# Altium project Solenoid-Switching-Board-v1.0.PrjPcb
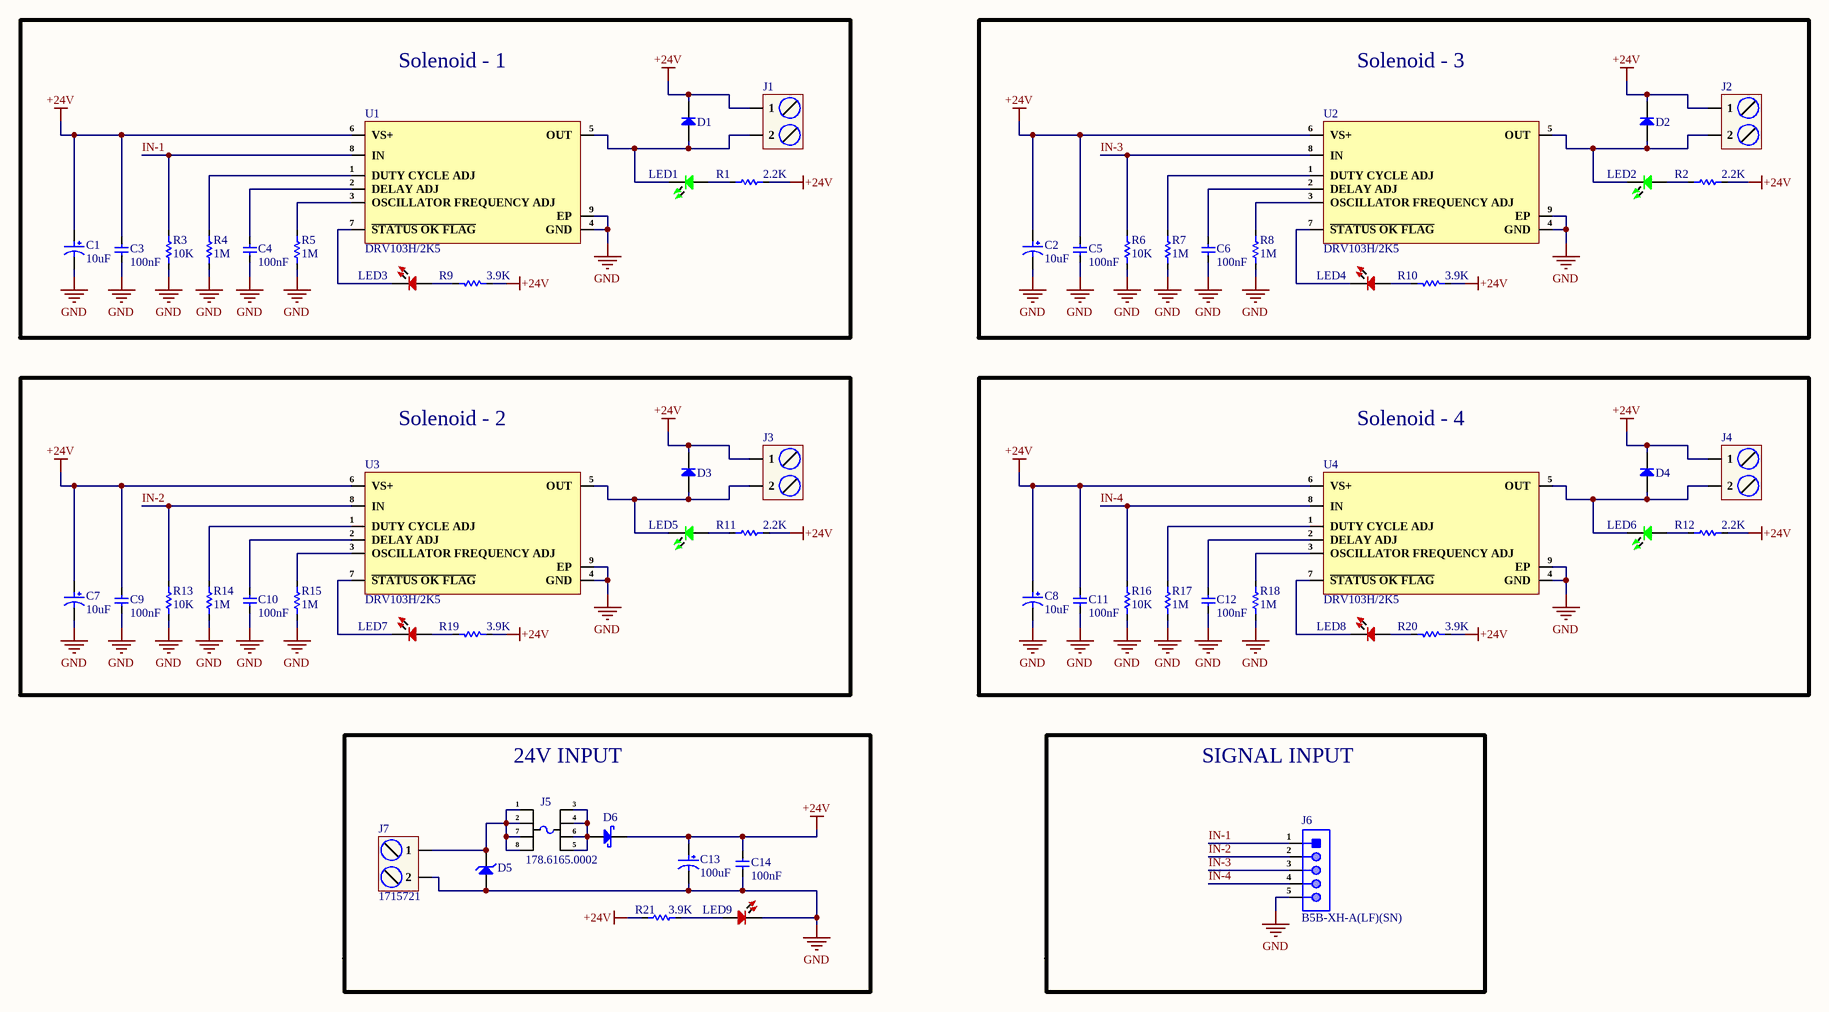
[diagram p0: Solenoid-Board.SchDoc]
1 sheet, 61 parts. Net scope: global (net labels, ports and power ports of the same name join across sheets).
Board file: PCB_Solenoid_Board-v1.0.PcbDoc

## Sheet Solenoid-Board.SchDoc
size 420 x 297 mm; SheetNumber: 1; SheetTotal: 1

### Parts
C1  10uF  [50SVPF10M]
C2  10uF  [50SVPF10M]
C3  100nF  [Cap-0603]
C4  100nF  [Cap-0603]
C5  100nF  [Cap-0603]
C6  100nF  [Cap-0603]
C7  10uF  [50SVPF10M]
C8  10uF  [50SVPF10M]
C9  100nF  [Cap-0603]
C10  100nF  [Cap-0603]
C11  100nF  [Cap-0603]
C12  100nF  [Cap-0603]
C13  100uF  [RVT1H101M0607]
C14  100nF  [Cap-0603]
D1  MURS360T3G  [SMC]  (value not drawn)
D2  MURS360T3G  [SMC]  (value not drawn)
D3  MURS360T3G  [SMC]  (value not drawn)
D4  MURS360T3G  [SMC]  (value not drawn)
D5  SMBJ28A-13-F  [SMB_]  (value not drawn)
D6  SS56  [SMA]  (value not drawn)
J1  DB125-3.81-2P-BK-S  [DB125-3.81-2P-BK-S]  (value not drawn)
J2  DB125-3.81-2P-BK-S  [DB125-3.81-2P-BK-S]  (value not drawn)
J3  DB125-3.81-2P-BK-S  [DB125-3.81-2P-BK-S]  (value not drawn)
J4  DB125-3.81-2P-BK-S  [DB125-3.81-2P-BK-S]  (value not drawn)
J5  178.6165.0002  [178.6165.0002]
J6  B5B-XH-A(LF)(SN)  [B5B-XH-A(LF)(SN)_]
J7  1715721  [1715721]
LED1  Emerald  [LED-0603]  (value not drawn)
LED2  Emerald  [LED-0603]  (value not drawn)
LED3  RED  [LED-0603]  (value not drawn)
LED4  RED  [LED-0603]  (value not drawn)
LED5  Emerald  [LED-0603]  (value not drawn)
LED6  Emerald  [LED-0603]  (value not drawn)
LED7  RED  [LED-0603]  (value not drawn)
LED8  RED  [LED-0603]  (value not drawn)
LED9  RED  [LED-0603]  (value not drawn)
R1  2.2K  [Res-0402]
R2  2.2K  [Res-0402]
R3  10K  [Res-0402]
R4  1M  [Res-0402]
R5  1M  [Res-0402]
R6  10K  [Res-0402]
R7  1M  [Res-0402]
R8  1M  [Res-0402]
R9  3.9K  [Res-0402]
R10  3.9K  [Res-0402]
R11  2.2K  [Res-0402]
R12  2.2K  [Res-0402]
R13  10K  [Res-0402]
R14  1M  [Res-0402]
R15  1M  [Res-0402]
R16  10K  [Res-0402]
R17  1M  [Res-0402]
R18  1M  [Res-0402]
R19  3.9K  [Res-0402]
R20  3.9K  [Res-0402]
R21  3.9K  [Res-0402]
U1  DRV103H/2K5  [8-SO PowerPad]
U2  DRV103H/2K5  [8-SO PowerPad]
U3  DRV103H/2K5  [8-SO PowerPad]
U4  DRV103H/2K5  [8-SO PowerPad]

### Blocks framed on the sheet
Solenoid - 1: C1 C3 C4 D1 J1 LED1 LED3 R1 R3-R5 R9 U1
Solenoid - 3: C2 C5 C6 D2 J2 LED2 LED4 R2 R6-R8 R10 U2
Solenoid - 2: C7 C9 C10 D3 J3 LED5 LED7 R11 R13-R15 R19 U3
Solenoid - 4: C8 C11 C12 D4 J4 LED6 LED8 R12 R16-R18 R20 U4
24V INPUT: C13 C14 D5 D6 J5 J7 LED9 R21
SIGNAL INPUT: J6

### Nets
+24V: C1.1 C2.1 C3.2 C5.2 C7.1 C8.1 C9.2 C11.2 C13.1 C14.2 D1.1(K) D2.1(K) D3.1(K) D4.1(K) D6.1(K) J1.1 J2.1 J3.1 J4.1 R1.2 R2.2 R9.1 R10.1 R11.2 R12.2 R19.1 R20.1 R21.1 U1.6(VS+) U2.6(VS+) U3.6(VS+) U4.6(VS+)
GND: C1.2 C2.2 C3.1 C4.1 C5.1 C6.1 C7.2 C8.2 C9.1 C10.1 C11.1 C12.1 C13.2 C14.1 D5.1(A) J6.5 J7.2 LED9.2 R3.1 R4.1 R5.1 R6.1 R7.1 R8.1 R13.1 R14.1 R15.1 R16.1 R17.1 R18.1 U1.4(GND) U1.9(EP) U2.4(GND) U2.9(EP) U3.4(GND) U3.9(EP) U4.4(GND) U4.9(EP)
IN-1: J6.1 R3.2 U1.8(IN)
IN-2: J6.2 R13.2 U3.8(IN)
IN-3: J6.3 R6.2 U2.8(IN)
IN-4: J6.4 R16.2 U4.8(IN)
NetC4_2: C4.2 U1.2(DELAY_ADJ)
NetC6_2: C6.2 U2.2(DELAY_ADJ)
NetC10_2: C10.2 U3.2(DELAY_ADJ)
NetC12_2: C12.2 U4.2(DELAY_ADJ)
NetD1_2: D1.2(A) J1.2 LED1.2 U1.5(OUT)
NetD2_2: D2.2(A) J2.2 LED2.2 U2.5(OUT)
NetD3_2: D3.2(A) J3.2 LED5.2 U3.5(OUT)
NetD4_2: D4.2(A) J4.2 LED6.2 U4.5(OUT)
NetD5_2: D5.2(K) J5.1 J5.2 J5.7 J5.8 J7.1
NetD6_2: D6.2(A) J5.3 J5.4 J5.5 J5.6
NetLED1_1: LED1.1 R1.1
NetLED2_1: LED2.1 R2.1
NetLED3_1: LED3.1 R9.2
NetLED3_2: LED3.2 U1.7(~{STATUS_OK_FLAG})
NetLED4_1: LED4.1 R10.2
NetLED4_2: LED4.2 U2.7(~{STATUS_OK_FLAG})
NetLED5_1: LED5.1 R11.1
NetLED6_1: LED6.1 R12.1
NetLED7_1: LED7.1 R19.2
NetLED7_2: LED7.2 U3.7(~{STATUS_OK_FLAG})
NetLED8_1: LED8.1 R20.2
NetLED8_2: LED8.2 U4.7(~{STATUS_OK_FLAG})
NetLED9_1: LED9.1 R21.2
NetR4_2: R4.2 U1.1(DUTY_CYCLE_ADJ)
NetR5_2: R5.2 U1.3(OSCILLATOR_FREQUENCY_ADJ)
NetR7_2: R7.2 U2.1(DUTY_CYCLE_ADJ)
NetR8_2: R8.2 U2.3(OSCILLATOR_FREQUENCY_ADJ)
NetR14_2: R14.2 U3.1(DUTY_CYCLE_ADJ)
NetR15_2: R15.2 U3.3(OSCILLATOR_FREQUENCY_ADJ)
NetR17_2: R17.2 U4.1(DUTY_CYCLE_ADJ)
NetR18_2: R18.2 U4.3(OSCILLATOR_FREQUENCY_ADJ)

### Notes on the sheet
- File:
- Title:
- Date:
- Page
- Num:
- Total:
- Drawn By: Huzaifa Ali

### Library data of the parts
C1 C2 C7 C8 = 50SVPF10M: CAP ALUM POLY 10UF 20% 50V SMD; Manufacturer: Panasonic; Material: 4242ConductorMaterial; Item Type: Capacitor; Supplier: Mouser; Supplier Part Number: 667-50SVPF10M; Manufacturer Part Number: 50SVPF10M; RoHS: Yes; Category: Polymer Capacitors; Stock: 29802; Pricing: 1=1.12, 10=0.801, 50=0.801, 100=0.665, 1000=0.555, 10000=0.504 (USD); ComponentLink1URL: https://datasheet.ciiva.com/48542/svpf-eng-ds-48542427.pdf?src-supplier=Distrelec; ComponentLink1Description: https://datasheet.ciiva.com/48542/svpf-eng-ds-48542427.pdf?src-supplier=Distrelec; ComponentLink2URL: https://datasheet.ciiva.com/24216/svpf-os-262415-24216043.pdf?src-supplier=Mouser; ComponentLink2Description: https://datasheet.ciiva.com/24216/svpf-os-262415-24216043.pdf?src-supplier=Mouser; ComponentLink3URL: https://datasheet.ciiva.com/25761/1734360-25761263.pdf?src-supplier=Farnell; ComponentLink3Description: https://datasheet.ciiva.com/25761/1734360-25761263.pdf?src-supplier=Farnell; LCSC Part Number: C2162323
C3-C6 C9-C12 C14 = CC0603KRX5R9BB104: CAP CER 0.1UF 50V X5R 0603; Manufacturer: Yageo; Tolerance: 10%; Item Type: Capacitor; Supplier 1: Digi-Key; Manufacturer Part Number: CC0603KRX5R9BB104; RoHS: Yes; Category: Ceramic Capacitors; Stock 1: 152253; Pricing 1: 1=0.10000, 10=0.05200, 50=0.02820, 100=0.02310, 500=0.01648, 1000=0.01294 (USD); Mount: Surface Mount; Case/Package: 0603; Case Code (Imperial): 0603; Case Code (Metric): 1608; Weight: 7.1E-05oz; Min Operating Temperature: -55°C; Max Operating Temperature: 85°C; Capacitance: 100nF; Packaging: Tape and Reel; Voltage Rating: 50V; Dielectric: X5R; Termination: SMD/SMT; Voltage Rating (DC): 50V; Package Quantity: 4000; Length: 0.063inch; Width: 0.031inch; Thickness: 0.035inch; Lead Free: Lead Free; Halogen Free: Halogen Free; ComponentLink1URL: http://www.mouser.com/ds/2/447/Yageo_UPY-GP_NP0_16V-to-50V_9-358835.pdf?src-supplier=Mouser; ComponentLink1Description: http://www.mouser.com/ds/2/447/Yageo_UPY-GP_NP0_16V-to-50V_9-358835.pdf?src-supplier=Mouser; ComponentLink2URL: https://www.yageo.com/upload/media/product/productsearch/datasheet/mlcc/UPY-GPHC_X5R_4V-to-50V_26.pdf?src-supplier=Digi-Key; ComponentLink2Description: https://www.yageo.com/upload/media/product/productsearch/datasheet/mlcc/UPY-GPHC_X5R_4V-to-50V_26.pdf?src-supplier=Digi-Key; ComponentLink3URL: http://www.yageo.com/exep/pages/download/literatures/ProductSelectionGuide%202014_Final_2.pdf?src-supplier=Digi-Key; ComponentLink3Description: http://www.yageo.com/exep/pages/download/literatures/ProductSelectionGuide%202014_Final_2.pdf?src-supplier=Digi-Key; Supplier Part Number 1: 311-4046-1-ND; LCSC Part Number: C110022
C13 = RVT1H101M0607: 100uF 50V ±20% SMD,D6.3xL7.7mm Aluminum Electrolytic Capacitors - SMD ROHS; Manufacturer: ROQANG; Manufacturer Part Number: RVT1H101M0607; Package: SMD,D6.3xL7.7mm; LCSC Part Number: C3151829; Item Type: Capacitor; ComponentLink1Description: LCSC; ComponentLink1URL: https://www.lcsc.com/product-detail/Aluminum-Electrolytic-Capacitors-SMD_ROQANG-RVT1H101M0607_C3151829.html
D1-D4 = MURS360T3G: SMC(DO-214AB) Diodes - Fast Recovery Rectifiers ROHS; Manufacturer: FUXINSEMI; Manufacturer Part Number: MURS360T3G; Package: SMC(DO-214AB); LCSC Part Number: C7436549; Item Type: Diodes; ComponentLink1Description: LCSC; ComponentLink1URL: https://www.lcsc.com/product-detail/Diodes-Fast-Recovery-Rectifiers_FUXINSEMI-MURS360T3G_C7436549.html
D5 = SMBJ28A-13-F: TVS DIODE 28VWM 45.4VC SMB; Manufacturer: Diodes; Test Current: 1mA; Number of Elements: 1; Power Dissipation: 600W; Forward Voltage: 5V; Direction: Unidirectional; Reverse Breakdown Voltage: 31.1V; Max Surge Current: 13.2A; Reverse Standoff Voltage: 28V; Clamping Voltage: 45.4V; Power Line Protection: No; Breakdown Voltage: 35.8V; Max Reverse Leakage Current: 5uA; Value: 330pF; Diode Type: ZENER; Supplier: Future Electronics; Supplier Part Number: 8797342; Manufacturer Part Number: SMBJ28A-13-F; RoHS: Yes; Category: TVS Diodes; Stock: 39000; Pricing: 3000=0.0734, 9000=0.0706, 15000=0.0693, 30000=0.0676, 60000=0.065 (USD); Mounting Technology: Surface Mount; Case/Package: SMB; Pins: 2; Min Operating Temperature: -55°C; Max Operating Temperature: 150°C; Packaging: Tape and Reel; Package Quantity: 3000; Max Power Dissipation: 600W; Series: SMBJ; Number of Unidirectional Channels: 1; Min Breakdown Voltage: 31.1V; Peak Pulse Power: 600W; Polarity: Unidirectional; Termination: SMD/SMT; Peak Pulse Current: 13.2A; Max Breakdown Voltage: 35.8V; Leakage Current: 5uA; Working Voltage: 28V; Voltage Rating (DC): 28V; Max Output current: 13.2A; Clamping Voltage-Max: 45.4V; Length: 4.57mm; Width: 3.9mm; Height: 2.62mm; Radiation Hardening: No; RoHS Compliant: Yes; Lead Free: Lead Free; ComponentLink1URL: https://datasheet.ciiva.com/16387/ds19002-16387564.pdf?src-supplier=Future+Electronics; ComponentLink1Description: https://datasheet.ciiva.com/16387/ds19002-16387564.pdf?src-supplier=Future+Electronics; ComponentLink2URL: https://datasheet.ciiva.com/26912/getdatasheetpartid-234000-26912533.pdf?src-supplier=Verical; ComponentLink2Description: https://datasheet.ciiva.com/26912/getdatasheetpartid-234000-26912533.pdf?src-supplier=Verical; Item Type: Diode
D6 = SS56: DIODE SCHOTTKY 60V 5A SMA; Manufacturer: MDD; LCSC Par Number: C65009; Manufacturer Part Number: SS56; Iterm Type: Diode; ComponentLink1Description: LCSC; ComponentLink1URL: https://www.lcsc.com/product-detail/Schottky-Barrier-Diodes-SBD_MDD-Microdiode-Electronics-SS56_C65009.html
J1-J4 = DB125-3.81-2P-BK-S: 1x2P 10A -40℃~+105℃ 300V Black 16~26 Straight 3.81mm 0.5~1 1 2 Plugin,P=3.81mm Screw terminal ROHS; Manufacturer: DORABO; Item Type: Terminal Block; Manufacturer Part Number: DB125-3.81-2P-BK-S; Package: Plugin,P=3.81mm; LCSC Part Number: C430618; ComponentLink1Description: LCSC; ComponentLink1URL: https://www.lcsc.com/product-detail/Screw-terminal_DORABO-DB125-3-81-2P-BK-S_C430618.html
J5 = 178.6165.0002: FUSE HOLDER BLADE 80V PCB; Manufacturer: Littelfuse Wickmann; Body Material: 4896ConductorMaterial; Current Rating: 30A; Supplier: Future Electronics; Supplier Part Number: 9883406; Manufacturer Part Number: 178.6165.0002; RoHS: Yes; Category: Fuse Holders; Stock: 3811; Pricing: 1=2.02, 40=1.96, 125=1.91, 400=1.86, 1250=1.77 (USD); Material: 4896ConductorMaterial; Width: 17.5mm; Thickness: 6mm; Lead Free: 5697LeadFree; ComponentLink1URL: https://datasheet.ciiva.com/295/littelfuse-ato-pcb-fuse-holders-178-6765-295568.pdf?src-supplier=Digikey; ComponentLink1Description: https://datasheet.ciiva.com/295/littelfuse-ato-pcb-fuse-holders-178-6765-295568.pdf?src-supplier=Digikey; ComponentLink2URL: https://datasheet.ciiva.com/4480/flrholder-58019-4480354.pdf?src-supplier=Mouser; ComponentLink2Description: https://datasheet.ciiva.com/4480/flrholder-58019-4480354.pdf?src-supplier=Mouser; ComponentLink3URL: https://datasheet.ciiva.com/16372/flrholder-16372408.pdf?src-supplier=Future+Electronics; ComponentLink3Description: https://datasheet.ciiva.com/16372/flrholder-16372408.pdf?src-supplier=Future+Electronics; ComponentLink4URL: https://datasheet.ciiva.com/15187/getdatasheetpartid-31610-15187861.pdf?src-supplier=Verical; ComponentLink4Description: https://datasheet.ciiva.com/15187/getdatasheetpartid-31610-15187861.pdf?src-supplier=Verical; LCSC Part Number: C207061; Item Type: Fuse Holder
J6 = B5B-XH-A(LF)(SN): Conn Shrouded Header HDR 5 POS 2.5mm Solder ST Thru-Hole Box; Manufacturer: JST; Current Rating: 3A; Contact Resistance: 20mR; Voltage Rating (AC): 250V; Number of Positions: 5; Insulation Resistance: 1GR; Gender: Male; Wire/Cable Gauge: 22AWG; Contact Post Length: 0.134inch; Mated Stacking Heights: 9.8mm; Item Type: JST Connector; Supplier 1: Digi-Key; Manufacturer Part Number: B5B-XH-A(LF)(SN); RoHS: Yes; Category: Headers and Wire Housings; Stock 1: 1949; Pricing 1: 1=0.25000, 10=0.23700, 100=0.16440, 500=0.13914, 1000=0.11383, 5000=0.10119, 10000=0.09170 (USD); Mount: Through Hole; Contact Material: Brass; Color: Natural; Contact Plating: Tin,Lead,Copper; Housing Color: White; Housing Material: Polyamide; Contact Shape: Square; Contact Finish - Mating: TIN; Insulation Material: Nylon; Insulation Color: Natural; Min Operating Temperature: -25°C; Max Operating Temperature: 85°C; Number of Rows: 1; Packaging: Bulk; Voltage Rating: 250V; Max Current Rating: 3A; Termination: Press-Fit; Fastening Type: Detent; Number of Contacts: 5; Max Voltage Rating (AC): 250V; Orientation: Straight; Connector Type: Header; Series: XH; Contact Type: Male Pin; Length: 14.9mm; Pitch: 2.5mm; Lead Pitch: 2.5mm; Depth: 5.75mm; Insulation Height: 0.276inch; REACH SVHC: No SVHC; Lead Free: Lead Free; Flammability Rating: UL94 V-0; ComponentLink1URL: https://datasheet.ciiva.com/26894/getdatasheetpartid-455618-26894798.pdf?src-supplier=Verical; ComponentLink1Description: https://datasheet.ciiva.com/26894/getdatasheetpartid-455618-26894798.pdf?src-supplier=Verical; ComponentLink2URL: https://datasheet.ciiva.com/11746/0900766b8082f55f-11746654.pdf?src-supplier=RSComponents; ComponentLink2Description: https://datasheet.ciiva.com/11746/0900766b8082f55f-11746654.pdf?src-supplier=RSComponents; ComponentLink3URL: https://datasheet.ciiva.com/26894/getdatasheetpartid-640991-26894479.pdf?src-supplier=Verical; ComponentLink3Description: https://datasheet.ciiva.com/26894/getdatasheetpartid-640991-26894479.pdf?src-supplier=Verical; ComponentLink4URL: https://datasheet.ciiva.com/8052/1684882-8052063.pdf?src-supplier=Element14; ComponentLink4Description: https://datasheet.ciiva.com/8052/1684882-8052063.pdf?src-supplier=Element14; ComponentLink5URL: https://datasheet.ciiva.com/20207/523653-20207174.pdf?src-supplier=Rapid+Electronics; ComponentLink5Description: https://datasheet.ciiva.com/20207/523653-20207174.pdf?src-supplier=Rapid+Electronics; ComponentLink6URL: https://datasheet.ciiva.com/724/exh-724390.pdf?src-supplier=Digi-Key; ComponentLink6Description: https://datasheet.ciiva.com/724/exh-724390.pdf?src-supplier=Digi-Key; Supplier Part Number 1: 455-2270-ND; LCSC Part Number: C157991
J7 = 1715721: TERM BLK 2P SIDE ENT 5.08MM PCB; Manufacturer: Phoenix Contact; Item Type: Terminal Blocks; Supplier: Digikey; Supplier Part Number: 277-1263-ND; Manufacturer Part Number: 1715721; RoHS: Yes; Stock: 13160; Pricing: 1=0.94 (USD); ComponentLink1URL: https://datasheet.ciiva.com/1120/1697161-1120393.pdf?src-supplier=Farnell; ComponentLink1Description: https://datasheet.ciiva.com/1120/1697161-1120393.pdf?src-supplier=Farnell; ComponentLink2URL: https://datasheet.ciiva.com/832/1715721-832095.pdf?src-supplier=Digikey; ComponentLink2Description: https://datasheet.ciiva.com/832/1715721-832095.pdf?src-supplier=Digikey; ComponentLink3URL: https://datasheet.ciiva.com/15169/getdatasheetpartid-212174-15169929.pdf?src-supplier=Verical; ComponentLink3Description: https://datasheet.ciiva.com/15169/getdatasheetpartid-212174-15169929.pdf?src-supplier=Verical; ComponentLink4URL: https://datasheet.ciiva.com/16046/1715721-16046034.pdf?src-supplier=Onlinecomponents.com; ComponentLink4Description: https://datasheet.ciiva.com/16046/1715721-16046034.pdf?src-supplier=Onlinecomponents.com
LED1 LED2 LED5 LED6 = NCD0603G2: Emerald 0603 Light Emitting Diodes (LED) ROHS; Manufacturer: Foshan NationStar Optoelectronics; Manufacturer Part Number: NCD0603G2; Package: 0603; LCSC Part Number: C87326; Item Type: LED; ComponentLink1Description: LCSC; ComponentLink1URL: https://www.lcsc.com/product-detail/Light-Emitting-Diodes-LED_Foshan-NationStar-Optoelectronics-NCD0603G2_C87326.html
LED3 LED4 LED7-LED9 = NCD0603R3: RED LED 0603 Light Emitting Diodes; Manufacturer: Foshan NationStar Optoelectronics; Manufacturer Part Number: NCD0603R3; Package: 0603; Item Type: LED; LCSC Part Number: C3151730; ComponentLink1Description: LCSC; ComponentLink1URL: https://www.lcsc.com/product-detail/Light-Emitting-Diodes-LED_Foshan-NationStar-Optoelectronics-NCD0603R3_C3151730.html
R1 R2 R11 R12 = RC0402FR-072K2L: RES SMD 2.2K OHM 1% 1/16W 0402; Manufacturer: Yageo; Resistance: 2.2kR; Power Rating: 63mW; Voltage Rating: 50V; Temperature Coefficient: 100ppm/°C; Supplier 1: Digi-Key; Manufacturer Part Number: RC0402FR-072K2L; Stock 1: 966157; Pricing 1: 1=0.1, 10=0.016, 100=0.0066, 1000=0.00299, 2500=0.00259, 5000=0.00214 (USD); Case/Package: 0402; Case Code (Imperial): 0402; Case Code (Metric): 1005; Weight: 2.3E-05oz; Size Code: 0402; Min Operating Temperature: -55°C; Max Operating Temperature: 155°C; Resistor Type: Thick Film; Packaging: Tape and Reel; Tolerance: 1%; Termination: SMD/SMT; Features: Moisture Resistant; Series: RC; Max Power Dissipation: 63mW; Number of Terminations: 2; Resistance Tolerance: 1%; Construction: Rectangular; Technology: THICK FILM; Length: 1mm; Width: 0.5mm; Height: 0.35mm; Depth: 0.5mm; RoHS Compliant: Yes; REACH SVHC: Unknown; Military Standard: Not; Lead Free: Lead Free; ComponentLink1URL: http://www.farnell.com/datasheets/2167052.pdf?src-supplier=Element14; ComponentLink1Description: http://www.farnell.com/datasheets/2167052.pdf?src-supplier=Element14; ComponentLink2URL: http://www.yageo.com/documents/recent/PYu-RC_Group_51_RoHS_L_9.pdf?src-supplier=Mouser; ComponentLink2Description: http://www.yageo.com/documents/recent/PYu-RC_Group_51_RoHS_L_9.pdf?src-supplier=Mouser; ComponentLink3URL: http://documents.rs-components.com/techlib://itc_doclist_GB.htm?stockno=6186532&src-supplier=RSComponents; ComponentLink3Description: http://documents.rs-components.com/techlib://itc_doclist_GB.htm?stockno=6186532&src-supplier=RSComponents; ComponentLink4URL: http://www.yageo.com/documents/recent/PYu-RC0402_51_RoHS_L_6_r.pdf?src-supplier=Future+Electronics; ComponentLink4Description: http://www.yageo.com/documents/recent/PYu-RC0402_51_RoHS_L_6_r.pdf?src-supplier=Future+Electronics; Supplier Part Number 1: 311-2.20KLRCT-ND; LCSC Part Number: C114762
R3 R6 R13 R16 = RC0402FR-0710KL: RES 10K OHM 1% 1/16W 0402; Manufacturer: Yageo; Resistance: 10kR; Voltage Rating (DC): 50V; Temperature Coefficient: 100ppm/°C; Power Rating: 62.5mW; Max Power Dissipation: 63mW; Item Type: Resistor; Supplier 1: Mouser; Manufacturer Part Number: RC0402FR-0710KL; RoHS: Yes; Category: Chip SMD Resistors; Stock 1: 18648329; Pricing 1: 1=0.10000, 10=0.01400, 50=0.01400, 100=0.00500, 1000=0.00300, 10000=0.00200 (USD); Case/Package: 0402; Number of Pins: 2; Case Code (Imperial): 0402; Case Code (Metric): 1005; Min Operating Temperature: -55°C; Max Operating Temperature: 155°C; Resistor Type: Thick Film; Tolerance: 1%; Packaging: Tape and Reel; Voltage Rating: 50V; Termination: SMD/SMT; Working Voltage: 50V; Number of Terminations: 2; Features: Moisture Resistant; Series: RC; Resistance Tolerance: 1%; Construction: Rectangular; Length: 1mm; Width: 0.5mm; Height: 0.32mm; Depth: 0.5mm; Lead Pitch: 0.2mm; REACH SVHC: No SVHC; Lead Free: Lead Free; RoHS Compliant: Yes; Military Standard: Not; ComponentLink1URL: https://datasheet.ciiva.com/7660/38568-7660787.pdf?src-supplier=Element14; ComponentLink1Description: https://datasheet.ciiva.com/7660/38568-7660787.pdf?src-supplier=Element14; ComponentLink2URL: https://datasheet.ciiva.com/7849/1686128-7849814.pdf?src-supplier=Element14; ComponentLink2Description: https://datasheet.ciiva.com/7849/1686128-7849814.pdf?src-supplier=Element14; ComponentLink3URL: https://datasheet.ciiva.com/7983/1018594-7983486.pdf?src-supplier=Element14; ComponentLink3Description: https://datasheet.ciiva.com/7983/1018594-7983486.pdf?src-supplier=Element14; ComponentLink4URL: https://datasheet.ciiva.com/22747/1018594-22747512.pdf?src-supplier=Element14; ComponentLink4Description: https://datasheet.ciiva.com/22747/1018594-22747512.pdf?src-supplier=Element14; ComponentLink5URL: https://datasheet.ciiva.com/12667/pyu-rc0402-51-rohs-l-6-r-12667067.pdf?src-supplier=Mouser; ComponentLink5Description: https://datasheet.ciiva.com/12667/pyu-rc0402-51-rohs-l-6-r-12667067.pdf?src-supplier=Mouser; ComponentLink6URL: https://datasheet.ciiva.com/7849/1784430-7849813.pdf?src-supplier=Element14; ComponentLink6Description: https://datasheet.ciiva.com/7849/1784430-7849813.pdf?src-supplier=Element14; ComponentLink7URL: https://datasheet.ciiva.com/7849/1784430-7849815.pdf?src-supplier=Element14; ComponentLink7Description: https://datasheet.ciiva.com/7849/1784430-7849815.pdf?src-supplier=Element14; Supplier Part Number 1: 603-RC0402FR-0710KL; LCSC Part Number: C60490
R4 R5 R7 R8 R14 R15 R17 R18 = RC0402FR-071ML: RES 1M OHM 1% 1/16W 0402; Manufacturer: Yageo; Value: 1MR; Power Rating: 63mW; Voltage Rating: 50V; Temperature Coefficient: 100ppm/°C; Item Type: Resistor; Supplier: Digikey; Supplier Part Number: 311-1.00MLRCT-ND; Manufacturer Part Number: RC0402FR-071ML; RoHS: Yes; Category: Chip SMD Resistors; Stock: 6516; Pricing: 1=0.1, 10=0.015, 50=0.0088, 100=0.0073, 500=0.00488, 1000=0.00417, 5000=0.00297 (USD); Case/Package: 0402; Case Code (Imperial): 0402; Case Code (Metric): 1005; Min Operating Temperature: -55°C; Max Operating Temperature: 155°C; Resistor Type: Thick Film; Packaging: Tape and Reel; Tolerance: 1%; Termination: SMD/SMT; Features: Moisture Resistant; Series: RC; Max Power Dissipation: 63mW; Number of Terminations: 2; Resistance Tolerance: 1%; Construction: Rectangular; Technology: THICK FILM; Voltage Rating (AC): 50V; Length: 1mm; Height: 0.32mm; Depth: 0.5mm; RoHS Compliant: Yes; Military Standard: Not; Reach SVHC Compliant: Unknown; Lead Free: 5697LeadFree; ComponentLink1URL: https://datasheet.ciiva.com/11808/0900766b80c66297-11808125.pdf?src-supplier=Rs; ComponentLink1Description: https://datasheet.ciiva.com/11808/0900766b80c66297-11808125.pdf?src-supplier=Rs; ComponentLink2URL: https://datasheet.ciiva.com/46394/1018594-46394951.pdf?src-supplier=Element14; ComponentLink2Description: https://datasheet.ciiva.com/46394/1018594-46394951.pdf?src-supplier=Element14; ComponentLink3URL: https://datasheet.ciiva.com/7849/1018594-7849883.pdf?src-supplier=Element14; ComponentLink3Description: https://datasheet.ciiva.com/7849/1018594-7849883.pdf?src-supplier=Element14; ComponentLink4URL: https://datasheet.ciiva.com/7849/1018594-7849882.pdf?src-supplier=Element14; ComponentLink4Description: https://datasheet.ciiva.com/7849/1018594-7849882.pdf?src-supplier=Element14; ComponentLink5URL: https://datasheet.ciiva.com/16741/pyu-rc0402-51-rohs-l-6-r-16741081.pdf?src-supplier=Future+Electronics; ComponentLink5Description: https://datasheet.ciiva.com/16741/pyu-rc0402-51-rohs-l-6-r-16741081.pdf?src-supplier=Future+Electronics; LCSC Part Number: C138033
R9 R10 R19-R21 = RC0402FR-073K9L: RES 3.9K OHM 1% 1/16W 0402; Manufacturer: Yageo; Temperature Coefficient: 100ppm/°C; Power Rating: 62.5mW; Value: 3.9kR; Voltage Rating: 50V; Max Power Dissipation: 63mW; Item Type: Resistor; Supplier: Future Electronics; Supplier Part Number: 9808155; Manufacturer Part Number: RC0402FR-073K9L; RoHS: Yes; Category: Chip SMD Resistors; Stock: 6910000; Pricing: 10000=0.0011, 100000=0.0011, 300000=0.001, 750000=0.001, 2000000=0.0009 (USD); Case/Package: 0402; Case Code (Imperial): 0402; Case Code (Metric): 1005; Min Operating Temperature: -55°C; Max Operating Temperature: 155°C; Tolerance: 1%; Packaging: Tape and Reel; Resistor Type: Thick Film; Series: RC; Termination: SMD/SMT; Number of Terminations: 2; Features: Moisture Resistant; Resistance Tolerance: 1%; Construction: Rectangular; Voltage Rating (AC): 50V; Length: 1mm; Depth: 0.5mm; Lead Free: Lead Free; RoHS Compliant: Yes; Reach SVHC Compliant: Unknown; Military Standard: Not; ComponentLink1URL: https://datasheet.ciiva.com/12666/pyu-rc0402-51-rohs-l-6-r-12666997.pdf?src-supplier=Mouser; ComponentLink1Description: https://datasheet.ciiva.com/12666/pyu-rc0402-51-rohs-l-6-r-12666997.pdf?src-supplier=Mouser; ComponentLink2URL: https://datasheet.ciiva.com/7849/1018594-7849989.pdf?src-supplier=Element14; ComponentLink2Description: https://datasheet.ciiva.com/7849/1018594-7849989.pdf?src-supplier=Element14; ComponentLink3URL: https://datasheet.ciiva.com/7849/1018594-7849990.pdf?src-supplier=Element14; ComponentLink3Description: https://datasheet.ciiva.com/7849/1018594-7849990.pdf?src-supplier=Element14; ComponentLink4URL: https://datasheet.ciiva.com/15189/getdatasheetpartid-469246-15189453.pdf?src-supplier=Verical; ComponentLink4Description: https://datasheet.ciiva.com/15189/getdatasheetpartid-469246-15189453.pdf?src-supplier=Verical; LCSC Part Number: C131467
U1-U4 = DRV103H/2K5: IC PWR DRVR N-CHAN 1:1 8SOPWRPAD; Manufacturer: Texas Instruments; Number of Channels: 1NUMBER; Supplier: Mouser; LCSC Part Number: C544418; Manufacturer Part Number: DRV103H/2K5; RoHS: Yes; Item Type: IC; Stock: 2092; Pricing: 1=4.53, 10=3.85, 50=3.85, 100=3.33, 1000=2.39, 10000=2.24 (USD); Length: 4.89mm; Width: 3.9mm; Height: 1.7mm; Thickness: 1.48mm; Lead Free: 5697LeadFree; RoHS Compliant: 5897YesNo; ComponentLink1URL: https://datasheet.ciiva.com/15110/getdatasheetpartid-547625-15110691.pdf?src-supplier=Verical; ComponentLink1Description: https://datasheet.ciiva.com/15110/getdatasheetpartid-547625-15110691.pdf?src-supplier=Verical; ComponentLink2URL: https://datasheet.ciiva.com/1958/drv103-1958756.pdf?src-supplier=Digikey; ComponentLink2Description: https://datasheet.ciiva.com/1958/drv103-1958756.pdf?src-supplier=Digikey; ComponentLink3URL: https://datasheet.ciiva.com/1958/drv103-1958757.pdf?src-supplier=Digikey; ComponentLink3Description: https://datasheet.ciiva.com/1958/drv103-1958757.pdf?src-supplier=Digikey; ComponentLink4URL: https://datasheet.ciiva.com/1958/drv103-1958758.pdf?src-supplier=Digikey; ComponentLink4Description: https://datasheet.ciiva.com/1958/drv103-1958758.pdf?src-supplier=Digikey